# Altium project Rail Gun.PrjPcb
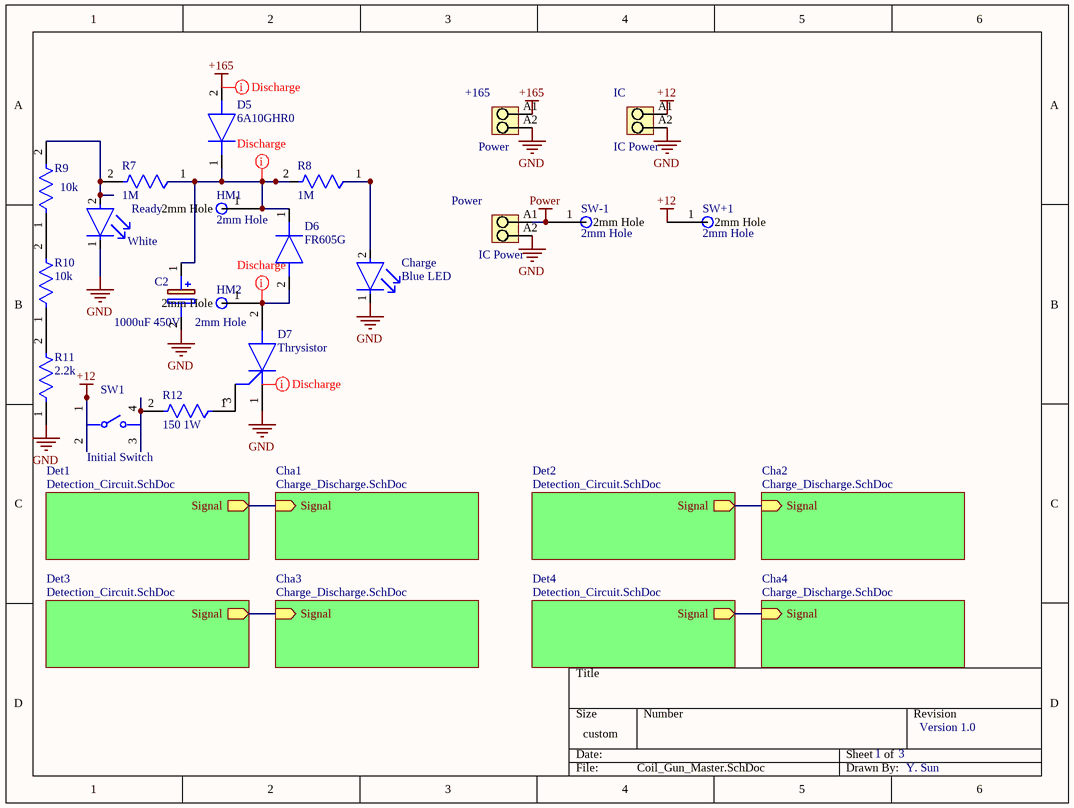
[diagram p0: Coil_Gun_Master.SchDoc]
3 sheets, 88 parts. Net scope: hierarchical (ports join the sheet entries above them; power ports are global).
Board file: Rail_Gun.PcbDoc
Sheets:
  Coil_Gun_Master.SchDoc
    Cha1 = Charge_Discharge.SchDoc
    Det1 = Detection_Circuit.SchDoc
    Cha2 = Charge_Discharge.SchDoc
    Det2 = Detection_Circuit.SchDoc
    Cha3 = Charge_Discharge.SchDoc
    Det3 = Detection_Circuit.SchDoc
    Cha4 = Charge_Discharge.SchDoc
    Det4 = Detection_Circuit.SchDoc

## Sheet Coil_Gun_Master.SchDoc
size 199 x 149 mm; SheetNumber: 1; SheetTotal: 3

### Parts
+165  Power  [PM_5_08_90_02]
C2  1000uF 450V  [CAPPRD1000W180D3550H6250]
Charge  Blue LED  [FP-XLUR12D-MFG]
D5  6A10GHR0  [DIOAD3685W130L885D700]
D6  FR605G  [DIOAD3685W130L885D700]
D7  Thrysistor  [FP-VS-70TPS12PBF-0]
HM1  2mm Hole  [2mmHole]
HM2  2mm Hole  [2mmHole]
IC  IC Power  [PM_5_08_90_02]
Power  IC Power  [PM_5_08_90_02]
R7  1M  [FP-CFR16-MFG]
R8  1M  [FP-CFR16-MFG]
R9  10k  [FP-CFR16-MFG]
R10  10k  [FP-CFR16-MFG]
R11  2.2k  [FP-CFR16-MFG]
R12  150 1W  [FP-RR01-MFG]
Ready  White  [FP-XLUR12D-MFG]
SW1  Initial Switch  [FP-1241_1625_8-MFG]
SW+1  2mm Hole  [2mmHole]
SW-1  2mm Hole  [2mmHole]

### Sub-sheets
Cha1 = Charge_Discharge.SchDoc: Signal (in)
Cha2 = Charge_Discharge.SchDoc: Signal (in)
Cha3 = Charge_Discharge.SchDoc: Signal (in)
Cha4 = Charge_Discharge.SchDoc: Signal (in)
Det1 = Detection_Circuit.SchDoc: Signal (out)
Det2 = Detection_Circuit.SchDoc: Signal (out)
Det3 = Detection_Circuit.SchDoc: Signal (out)
Det4 = Detection_Circuit.SchDoc: Signal (out)

### Nets
+12: IC.A1 SW1.1 SW1.2 SW+1.1(2mm_Hole)
+165: +165.A1 D5.2(A)
GND: +165.A2 C2.2(-) Charge.1(C) D7.1(K) IC.A2 Power.A2 R11.1 Ready.1(C)
Power: Power.A1 SW-1.1(2mm_Hole)
NetC2_1: C2.1(+) D5.1(K) D6.1(K) HM1.1(2mm_Hole) R7.1 R8.2
NetCharge_2: Charge.2(A) R8.1
NetD4_Cha1_3: sheet Cha1/Signal, sheet Det1/Signal
NetD4_Cha2_3: sheet Cha2/Signal, sheet Det2/Signal
NetD4_Cha3_3: sheet Cha3/Signal, sheet Det3/Signal
NetD4_Cha4_3: sheet Cha4/Signal, sheet Det4/Signal
NetD6_2: D6.2(A) D7.2(A) HM2.1(2mm_Hole)
NetD7_3: D7.3(G) R12.1
NetR7_2: R7.2 R9.2 Ready.2(A)
NetR9_1: R9.1 R10.2
NetR10_1: R10.1 R11.2
NetR12_2: R12.2 SW1.3 SW1.4

### Layout directives
net class Discharge: (no net found under the mark), +165, NetC2_1, NetD6_2

### Notes on the sheet
- 1
- 3
- Version 1.0
- Y. Sun

### Library data of the parts
+165 IC Power = CMP-1559-01627-1: OMNIMATE Signal - series PM; Manufacturer: Weidmueller; PartNumber: 1760490000; Contact_surface: tinned; Pitch_mm: 5,08 mm; Solid_min_H05_07_V_U: 0,13 mm²; Wire_cross_section_AWG_min_UL_1059: AWG 26; Wire_cross_section_AWG_max_UL_1059: AWG 14; Rated_voltage_for_surge_voltage_class_pollution_degree_II_2: 600 V; Rated_current_use_group_B_UL_1059: 15 A; Mounting_onto_the_PCB: Solder connection; Solder_pin_length_mm: 3,5 mm; Side_termination_characteristic: closed side; Contact_material: Cu-Leg; Pitch_inch: 0,2 inch; No_of_poles: 2; UL_94_flammability_rating: V-0; Insulating_material: Wemid (PA); Rated_voltage_use_group_B_UL_1059: 300 V; Solid_max_H05_07_V_U: 2,5 mm²; Short_text_for_material: PM 5.08/02/90 3.5SN OR BX; Revision: V1; Qty: 500 PCS; ComponentLink2Description: URL Link1; Packaging: Box; PackageReference: PM_5_08_90_02; ComponentLink2URL: http://catalog.weidmueller.com/catalog/Start.do?localeId=en&ObjectID=1760490000; Colour: Orange; ComponentLink1Description: Manufacturer URL; ComponentLink1URL: http://www.weidmueller.com/
C2 = EKHS451VSN102MA60S: Capacitor Polarised; Manufacturer_Name: Chemi-Con; Datasheet Link: https://www.mouser.cn/datasheet/2/420/United-Chemi-Con-1708643.pdf; Height: 62.5mm; Manufacturer_Part_Number: EKHS451VSN102MA60S
Charge Ready = CMP-02085-08376351-1: 627nm Red LED; 5x8.6mm, Through-Hole Mount with Red Diffused Round Lamp; Test Current: 10mA; Viewing Angle: 30°; Dominant Wavelength: 617nm; Luminous Intensity: 39mcd; Forward Voltage: 1.9V; Wavelength: 627nm; Case/Package: Radial; Lens Color: Red; Mount: Through Hole; Height: 8.6mm; Color: Red; Lifecycle Status: Production; Lens Transparency: Diffused; RoHS: Compliant
D5 D6 = 6A10GHR0: Diode; Manufacturer_Name: Taiwan Semiconductor; Datasheet Link: https://www.mouser.ca/ProductDetail/Taiwan-Semiconductor/6A10GHR0/?qs=iDAqbRYIEyDCJDGbzj9j3Q%3D%3D; Manufacturer_Part_Number: 6A10GHR0; Mouser Part Number: 821-6A10GHR0; Mouser Price/Stock: https://www.mouser.co.uk/ProductDetail/Taiwan-Semiconductor/6A10GHR0/?qs=iDAqbRYIEyDCJDGbzj9j3Q%3D%3D
D7 = CMP-02544-000003-1: SCR 1.2KV 75A SUPER-247; Hold Current: 200mA; Forward Voltage: 1.4V; Current Rating: 70A; RoHS Compliant: Yes; Min Operating Temperature: -40°C; Mount: Through Hole; Weight: 0.211644oz; Radiation Hardening: No; Series: -; Max Operating Temperature: 125°C; Packaging: Bulk; Package Quantity: 500; Length: 16.1mm; Max Repetitive Reverse Voltage (Vrrm): 1.2kV; Width: 5.5mm; RMS Current (Irms): 75A; Height: 20.8mm; Case/Package: TO-247; Number of Pins: 247; Contact Plating: Tin
HM1 HM2 SW+1 SW-1 = Hole2
R7-R11 = CMP-03212-000007-1: RES 120 OHM 1/4W 5% AXIAL; Resistance: 120R; Power Rating: 250mW; Number of Resistors: 1; Voltage Rating: 200V; Temperature Coefficient: 0ppm/°C; RoHS Compliant: Yes; Mount: Axial; Package Quantity: 5000; Diameter: 1.85mm; Number of Terminations: 2; Packaging: Cut Tape; Max Operating Temperature: 155°C; Resistance Tolerance: 5%; Termination: Axial; Length: 3.5mm; Max Power Dissipation: 250mW; Min Operating Temperature: -55°C; Resistor Type: Thin Film; Technology: CARBON FILM; Case/Package: Axial; Tolerance: 5%; Series: CFR16, Neohm; Voltage Rating (DC): 200V; ELV: Compliant; REACH SVHC: No SVHC
R12 = CMP-03212-000006-1: RES 100 OHM 5% 1W AXIAL; Temperature Coefficient: 300ppm/°C; Number of Resistors: 1; Resistance: 100R; Voltage Rating: 350V; Resistor Type: Power resistor; Mount: Axial; Power Rating: 1W; RoHS Compliant: Yes; Tolerance: 5%; Packaging: Ammo Pack; ELV: Compliant; Number of Terminations: 2; Case/Package: Axial
SW1 = CMP-26316-000004-1: SWITCH TACTILE SPST-NO 0.05A 42V; Illumination Type: Non-Illuminated; Mechanical Life: 1000000Cycles; Actuator Material: Polyphenylene; Switch Function: Off-Mom; Voltage Rating (AC): 30V; Actuator Type: Standard; Max Current Rating: 50mA; Ratings: IP67; Throw Configuration: SPST; Switch Travel: 0.35mm; Operating Force: 220gf; Max Operating Temperature: 85°C; Packaging: Bulk; Radiation Hardening: No; Max Voltage Rating (DC): 42V; Voltage Rating (DC): 42V; Termination: PC Pin; Min Operating Temperature: -40°C; Max Voltage Rating (AC): 30V; Mount: Through Hole; Weight: 0.003527oz; Current Rating: 50mA; RoHS Compliant: Yes; Series: PMS; Package Quantity: 100

## Sheet Charge_Discharge.SchDoc
size 100 x 129 mm; SheetNumber: 3; SheetTotal: 3
Used 4 times, as channels Cha1, Cha2, Cha3, Cha4. Parts and nets are listed once, with the designators drawn on the sheet.
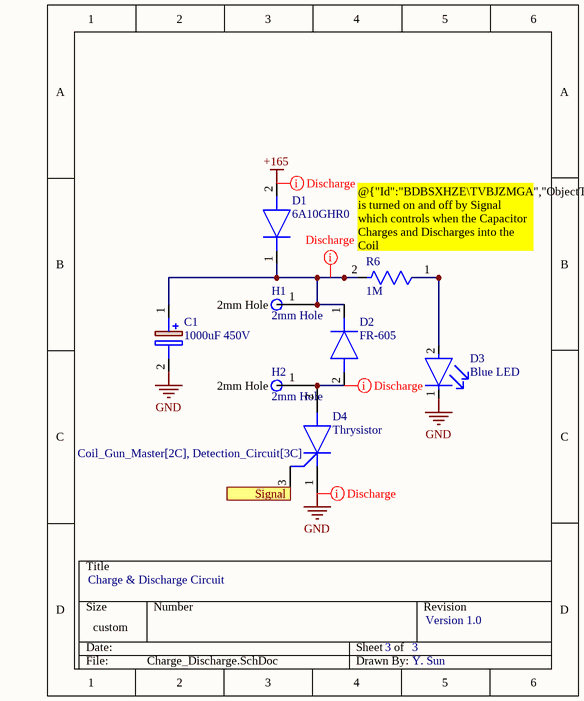
[diagram p1: Charge_Discharge.SchDoc]

### Parts
C1  1000uF 450V  [CAPPRD1000W180D3550H6250]
D1  6A10GHR0  [DIOAD3685W130L885D700]
D2  FR-605  [DIOAD3685W130L885D700]
D3  Blue LED  [FP-XLUR12D-MFG]
D4  Thrysistor  [FP-VS-70TPS12PBF-0]
H1  2mm Hole  [2mmHole]
H2  2mm Hole  [2mmHole]
R6  1M  [FP-CFR16-MFG]

### Ports
Signal (in, see Coil_Gun_Master[2C], Detection_Circuit[3C])

### Nets
+165: D1.2(A)
GND: C1.2(-) D3.1(C) D4.1(K)
Signal: D4.3(G) ; port Signal
NetC1_1: C1.1(+) D1.1(K) D2.1(K) H1.1(2mm_Hole) R6.2
NetD2_2: D2.2(A) D4.2(A) H2.1(2mm_Hole)
NetD3_2: D3.2(A) R6.1

### Channels
Cha1: designators end in _Cha1; ports Signal=NetD4_Cha1_3
Cha2: designators end in _Cha2; ports Signal=NetD4_Cha2_3
Cha3: designators end in _Cha3; ports Signal=NetD4_Cha3_3
Cha4: designators end in _Cha4; ports Signal=NetD4_Cha4_3

### Layout directives
net class Discharge: +165, GND, NetC1_Cha1_1, NetD2_Cha1_2

### Notes on the sheet
- (near R6) @{"Id":"BDBSXHZE\TVBJZMGA","ObjectType":2} is turned on and off by Signal which controls when the Capacitor Charges and Discharges into the Coil
- Charge & Discharge Circuit
- 3
- Version 1.0
- Y. Sun

### Library data of the parts
C1 = EKHS451VSN102MA60S: as C2 on sheet Coil_Gun_Master; Datasheet Link: https://www.mouser.cn/datasheet/2/420/United-Chemi-Con-1708643.pdf; Height: 62.5mm; Manufacturer_Part_Number: EKHS451VSN102MA60S
D1 D2 = 6A10GHR0: as D5 on sheet Coil_Gun_Master; Datasheet Link: https://www.mouser.ca/ProductDetail/Taiwan-Semiconductor/6A10GHR0/?qs=iDAqbRYIEyDCJDGbzj9j3Q%3D%3D; Manufacturer_Part_Number: 6A10GHR0; Mouser Part Number: 821-6A10GHR0; Mouser Price/Stock: https://www.mouser.co.uk/ProductDetail/Taiwan-Semiconductor/6A10GHR0/?qs=iDAqbRYIEyDCJDGbzj9j3Q%3D%3D
D3 = CMP-02085-08376351-1: as Charge on sheet Coil_Gun_Master; Wavelength: 627nm; Case/Package: Radial; Lens Color: Red; Mount: Through Hole; Height: 8.6mm; Color: Red; Lifecycle Status: Production; Lens Transparency: Diffused; RoHS: Compliant
D4 = CMP-02544-000003-1: as D7 on sheet Coil_Gun_Master; RoHS Compliant: Yes; Min Operating Temperature: -40°C; Mount: Through Hole; Weight: 0.211644oz; Radiation Hardening: No; Series: -; Max Operating Temperature: 125°C; Packaging: Bulk; Package Quantity: 500; Length: 16.1mm; Max Repetitive Reverse Voltage (Vrrm): 1.2kV; Width: 5.5mm; RMS Current (Irms): 75A; Height: 20.8mm; Case/Package: TO-247; Number of Pins: 247; Contact Plating: Tin
H1 H2 = Hole2
R6 = CMP-03212-000007-1: as R7 on sheet Coil_Gun_Master; RoHS Compliant: Yes; Mount: Axial; Package Quantity: 5000; Diameter: 1.85mm; Number of Terminations: 2; Packaging: Cut Tape; Max Operating Temperature: 155°C; Resistance Tolerance: 5%; Termination: Axial; Length: 3.5mm; Max Power Dissipation: 250mW; Min Operating Temperature: -55°C; Resistor Type: Thin Film; Technology: CARBON FILM; Case/Package: Axial; Tolerance: 5%; Series: CFR16, Neohm; Voltage Rating (DC): 200V; ELV: Compliant; REACH SVHC: No SVHC

## Sheet Detection_Circuit.SchDoc
size 114 x 127 mm; SheetNumber: 2; SheetTotal: 3
Used 4 times, as channels Det1, Det2, Det3, Det4. Parts and nets are listed once, with the designators drawn on the sheet.
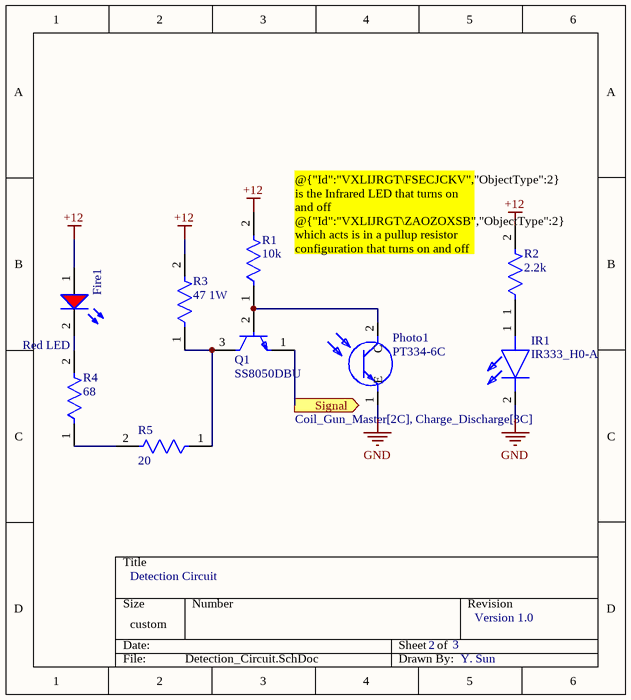
[diagram p2: Detection_Circuit.SchDoc]

### Parts
Fire1  Red LED  [WL-TMRC_D5.9H8.7]
IR1  IR333_H0-A  [IR333H0A]
Photo1  PT334-6C  [PT3346C]
Q1  SS8050DBU  [FP-135AN-MFG]
R1  10k  [FP-CFR16-MFG]
R2  2.2k  [FP-CFR16-MFG]
R3  47 1W  [FP-RR01-MFG]
R4  68  [FP-CFR16-MFG]
R5  20  [FP-CFR16-MFG]

### Ports
Signal (out, see Coil_Gun_Master[2C], Charge_Discharge[3C])

### Nets
+12: Fire1.1(A) R1.2 R2.2 R3.2
GND: IR1.2(K) Photo1.1(E)
Signal: Q1.1(E) ; port Signal
NetFire1_2: Fire1.2(K) R4.2
NetIR1_1: IR1.1(A) R2.1
NetPhoto1_2: Photo1.2(C) Q1.2(B) R1.1
NetQ1_3: Q1.3(C) R3.1 R5.1
NetR4_1: R4.1 R5.2

### Channels
Det1: designators end in _Det1; ports Signal=NetD4_Cha1_3
Det2: designators end in _Det2; ports Signal=NetD4_Cha2_3
Det3: designators end in _Det3; ports Signal=NetD4_Cha3_3
Det4: designators end in _Det4; ports Signal=NetD4_Cha4_3

### Notes on the sheet
- @{"Id":"VXLIJRGT\FSECJCKV","ObjectType":2} is the Infrared LED that turns on and off @{"Id":"VXLIJRGT\ZAOZOXSB","ObjectType":2} which acts is in a pullup resistor configuration that turns on and off the transistor that controls the Thrysistor
- Detection Circuit
- 2
- 3
- Version 1.0
- Y. Sun

### Library data of the parts
Fire1 = CMP-1488-00008-3: WL-TMRC Red Color Diffused 5 mm Round Through Hole LED; Manufacturer Lifecycle Status: ACTIVE; Forward Voltage: 2.1V; YEOL: 1 = Estimated lifetime > 10 years; Lens Size: 5mm; Lens Style: Circular, Diffused, Round; Luminous Intensity: 30mcd; Test Current: 20mA; Viewing Angle: 60°; Wavelength: 630nm; Max Reverse Voltage (DC): 5V; Forward Current: 100mA; Dominant Wavelength: 645nm; Peak Wavelength: 650nm; Height: 8.6mm; REACH SVHC: Unknown; Width: 5mm; RoHS: Compliant; Mount: Through Hole; Case/Package: Radial; Min Operating Temperature: -40°C; Length: 5mm; Max Operating Temperature: 85°C; Packaging: Bulk; Color: Red; Lifecycle Status: Production
IR1 = IR333_H0-A: LED; Manufacturer_Name: Everlight; Manufacturer_Part_Number: IR333/H0-A; Datasheet Link: https://datasheet.lcsc.com/lcsc/1808280419_Everlight-Elec-IR333-H0-A_C264292.pdf; Height: 10.4mm; Mouser Part Number: 638-IR333/H0-A; Mouser Price/Stock: https://www.mouser.co.uk/ProductDetail/Everlight/IR333-H0-A?qs=By6Nw2ByBD39%252BlkBkN%2FobQ%3D%3D
Photo1 = PT334-6C: Phototransistor; Manufacturer_Name: Everlight; Datasheet Link: https://ar.mouser.com/datasheet/2/143/EVER_S_A0003541250_1-2548712.pdf; Height: 10.4mm; Manufacturer_Part_Number: PT334-6C; Mouser Part Number: 638-PT334-6C; Mouser Price/Stock: https://www.mouser.co.uk/ProductDetail/Everlight/PT334-6C?qs=1zthkiRbLn0w%252B4NEo66uDw%3D%3D; Arrow Part Number: PT334-6C; Arrow Price/Stock: https://www.arrow.com/en/products/pt334-6c/everlight-electronics?utm_currency=USD&region=nac
Q1 = CMP-00278-84331634-1: SS8050DBU Bipolar (BJT) Single Transistor, NPN, 25 V, 100 MHz, 1 W, 1.5 A, 160; Manufacturer Lifecycle Status: ACTIVE; Collector Base Voltage (VCBO): 40V; Power Dissipation: 1W; Max Junction Temperature (Tj): 150°C; Frequency: 100MHz; Output Power: 2W; Collector Emitter Voltage (VCEO): 25V; Max Collector Current: 1.5A; Collector Emitter Saturation Voltage: 500mV; Number of Elements: 1; Emitter Base Voltage (VEBO): 6V; hFE Min: 85; RoHS: Compliant; Lifecycle Status: Production; Lead Free: Lead Free; Transition Frequency: 100MHz; Case/Package: TO-92; Width: 3.86mm; Min Operating Temperature: -65°C; Element Configuration: Single; Gain Bandwidth Product: 100MHz; REACH SVHC: No SVHC; Max Frequency: 100MHz; Radiation Hardening: No; Current Rating: 1.5A; Mount: Through Hole; Max Operating Temperature: 150°C; Polarity: NPN; Number of Pins: 3; Collector Emitter Breakdown Voltage: 25V; Schedule B: 8541290080, 8541290080; Packaging: Bulk; Weight: 179mg; NexarPartId: 84331634; Voltage Rating (DC): 25V; Max Power Dissipation: 1W; Height: 4.58mm; Length: 4.58mm
R1 R2 R4 R5 = CMP-03212-000007-1: as R7 on sheet Coil_Gun_Master; RoHS Compliant: Yes; Mount: Axial; Package Quantity: 5000; Diameter: 1.85mm; Number of Terminations: 2; Packaging: Cut Tape; Max Operating Temperature: 155°C; Resistance Tolerance: 5%; Termination: Axial; Length: 3.5mm; Max Power Dissipation: 250mW; Min Operating Temperature: -55°C; Resistor Type: Thin Film; Technology: CARBON FILM; Case/Package: Axial; Tolerance: 5%; Series: CFR16, Neohm; Voltage Rating (DC): 200V; ELV: Compliant; REACH SVHC: No SVHC
R3 = CMP-03212-000006-1: as R12 on sheet Coil_Gun_Master; Resistor Type: Power resistor; Mount: Axial; Power Rating: 1W; RoHS Compliant: Yes; Tolerance: 5%; Packaging: Ammo Pack; ELV: Compliant; Number of Terminations: 2; Case/Package: Axial

## Nets that join several sheets
+12: Coil_Gun_Master (IC.A1 SW1.1 SW1.2 SW+1.1), Det1 (Fire1_Det1.1 R1_Det1.2 R2_Det1.2 R3_Det1.2), Det2 (Fire1_Det2.1 R1_Det2.2 R2_Det2.2 R3_Det2.2), Det3 (Fire1_Det3.1 R1_Det3.2 R2_Det3.2 R3_Det3.2), Det4 (Fire1_Det4.1 R1_Det4.2 R2_Det4.2 R3_Det4.2)
+165: Coil_Gun_Master (+165.A1 D5.2), Cha1 (D1_Cha1.2), Cha2 (D1_Cha2.2), Cha3 (D1_Cha3.2), Cha4 (D1_Cha4.2)
GND: Coil_Gun_Master (8 pins), Cha1 (C1_Cha1.2 D3_Cha1.1 D4_Cha1.1), Det1 (IR1_Det1.2 Photo1_Det1.1), Cha2 (C1_Cha2.2 D3_Cha2.1 D4_Cha2.1), Det2 (IR1_Det2.2 Photo1_Det2.1), Cha3 (C1_Cha3.2 D3_Cha3.1 D4_Cha3.1), Det3 (IR1_Det3.2 Photo1_Det3.1), Cha4 (C1_Cha4.2 D3_Cha4.1 D4_Cha4.1), Det4 (IR1_Det4.2 Photo1_Det4.1)
NetD4_Cha1_3: Cha1 (D4_Cha1.3), Det1 (Q1_Det1.1)
NetD4_Cha2_3: Cha2 (D4_Cha2.3), Det2 (Q1_Det2.1)
NetD4_Cha3_3: Cha3 (D4_Cha3.3), Det3 (Q1_Det3.1)
NetD4_Cha4_3: Cha4 (D4_Cha4.3), Det4 (Q1_Det4.1)